# Altium schematic sheet ic_xe_dien.SchDoc
size A; SheetNumber: 1; SheetTotal: 1
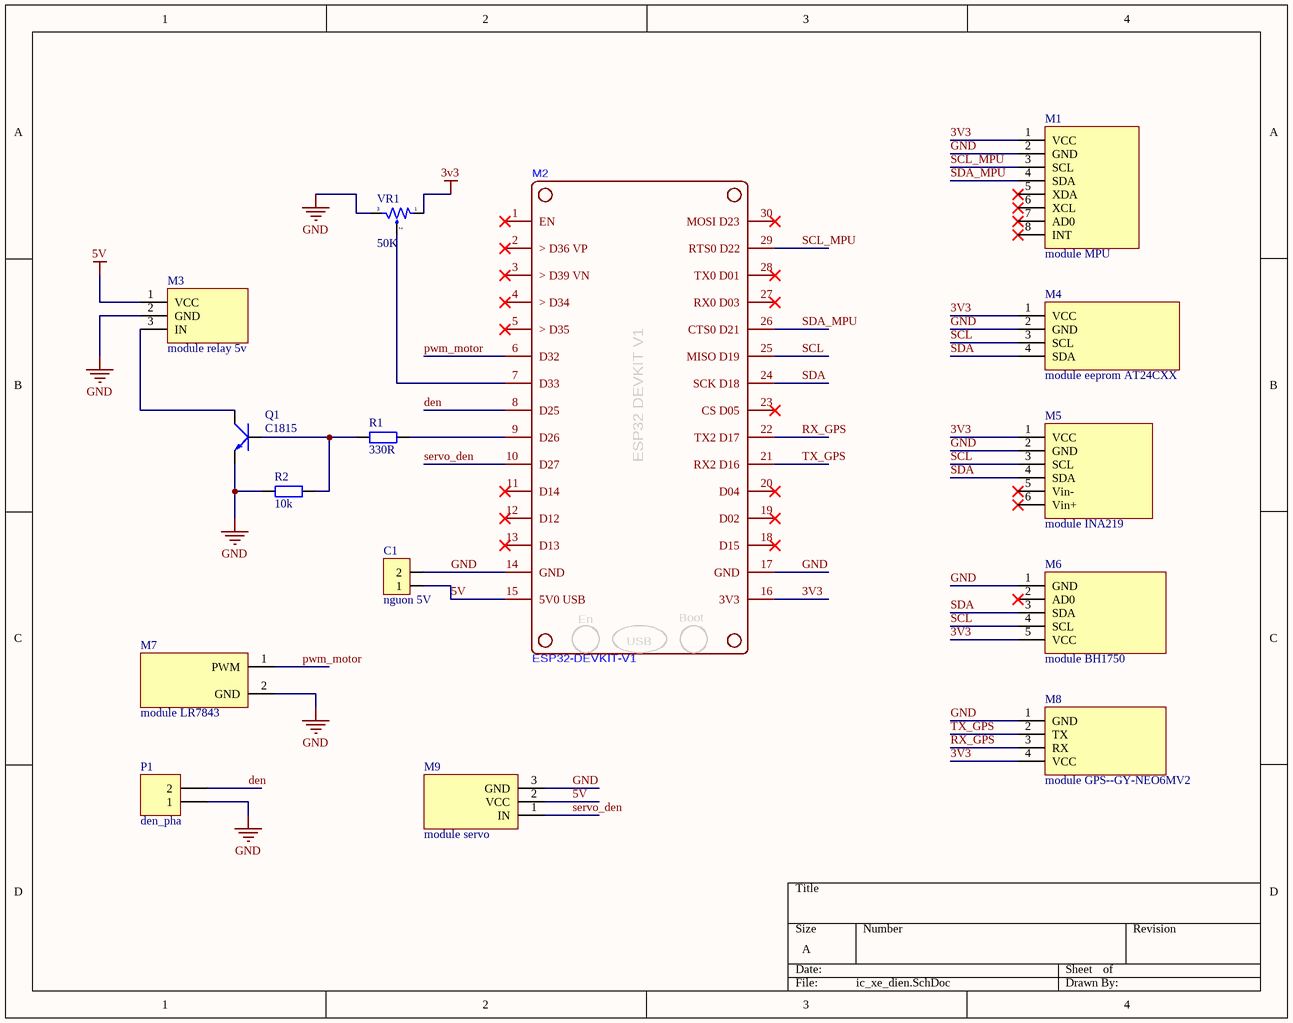
[diagram p0: ic_xe_dien.SchDoc]

## Parts
C1  nguon 5V  [KF-128_2P]
M1  module MPU  [MODULE MPU]
M2  ESP32-DEVKIT-V1  [ESP32]
M3  module relay 5v  [module relay 5v]
M4  module eeprom AT24CXX  [module eeprom at24]
M5  module INA219  [module INA219]
M6  module BH1750  [BH1750]
M7  module LR7843  [module LR7843]
M8  module GPS--GY-NEO6MV2  [module gps]
M9  module servo  [module one_wire]
P1  den_pha  [HDR1X2]
Q1  C1815  [TO92]
R1  330R  [tro vach 1/4w]
R2  10k  [tro vach 1/4w]
VR1  50K  [Bien Tro Volume Don]

## Nets
3V3: M1.1(VCC) M2.16(3V3) M4.1(VCC) M5.1(VCC) M6.5(VCC) M8.4(VCC) VR1.1
5V: C1.1 M2.15(5V0_USB) M3.1(VCC) M9.2(VCC)
GND: C1.2 M1.2(GND) M2.14(GND) M2.17(GND) M3.2(GND) M4.2(GND) M5.2(GND) M6.1(GND) M7.2(GND) M8.1(GND) M9.3(GND) P1.1 Q1.1(E) R2.1 VR1.3
den: M2.8(D25) P1.2
pwm_motor: M2.6(D32) M7.1(PWM)
RX_GPS: M2.22(TX2_D17) M8.3(RX)
SCL: M2.25(MISO_D19) M4.3(SCL) M5.3(SCL) M6.4(SCL)
SCL_MPU: M1.3(SCL) M2.29(RTS0_D22)
SDA: M2.24(SCK_D18) M4.4(SDA) M5.4(SDA) M6.3(SDA)
SDA_MPU: M1.4(SDA) M2.26(CTS0_D21)
servo_den: M2.10(D27) M9.1(IN)
TX_GPS: M2.21(RX2_D16) M8.2(TX)
NetM2_7: M2.7(D33) VR1.2
NetM2_9: M2.9(D26) R1.2
NetM3_3: M3.3(IN) Q1.2(C)
NetQ1_3: Q1.3(B) R1.1 R2.2

Not connected (* = marked no-connect by the designer): M1 5(XDA)* 6(XCL)* 7(AD0)* 8(INT)*; M2 1(EN)* 2(>_D36_VP)* 3(>_D39_VN)* 4(>_D34)* 5(>_D35)* 11(D14)* 12(D12)* 13(D13)* 18(D15)* 19(D02)* 20(D04)* 23(CS_D05)* 27(RX0_D03)* 28(TX0_D01)* 30(MOSI_D23)*; M5 5(Vin-)* 6(Vin+)*; M6 2(AD0)*

## Notes on the sheet
- (in symbol ESP32-DEVKIT-V1) ESP32 DEVKIT V1; En; Boot; USB

## Library data of the parts
C1 = Header2: Header IDC, 2 x 1 Pin Vertical 2.54mm Pitch (Non-Boxed, Male); Manufacturer: W¨¹rth Elektronik eiSos GmbH; partNo: 613002143121; ComponentLink1 Description: Manufacturer; ComponentLink2 Description: Datasheet; NoPins: 02; Created Date: 29 March 2013; ComponentLink1URL: http://www.we-online.com; ComponentLink2URL: http://katalog.we-online.de/em/datasheet/6130xx143121.pdf; Created by: Karrer Zheng
M9 = module one_wire
P1 = Header 2: Header, 2-Pin; LatestRevisionDate: 17-Jul-2002; LatestRevisionNote: Re-released for DXP Platform.; Publisher: Altium Limited
Q1 = Trans C1815 DIP: NPN transistor; Value: C9014
R1 = Tro Vach 1/4W 5% 330R: Cắm; Don_Vi: Con; So_Chan: 2; Ten_Linh_Kien: Trở Vạch 1/4W 5% 330R; Ma_Hang: MH007436; Chung_Loai: Cắm; Kieu_Chan: *
R2 = Tro Vach 1/4W 5% 10k: Căm; Chung_Loai: Cắm; Don_Vi: Con; So_Chan: 2; Ten_Linh_Kien: Trở Vạch 1/4w 5% 10K; Ma_Hang: MH007354; Kieu_Chan: *
VR1 = Triet Ap Don 50k: Cắm; Don_Vi: Con; Ten_Linh_Kien: Triết Áp Đơn B50K; Ma_Hang: MH001419; Kieu_Chan: *; Chung_Loai: Cắm